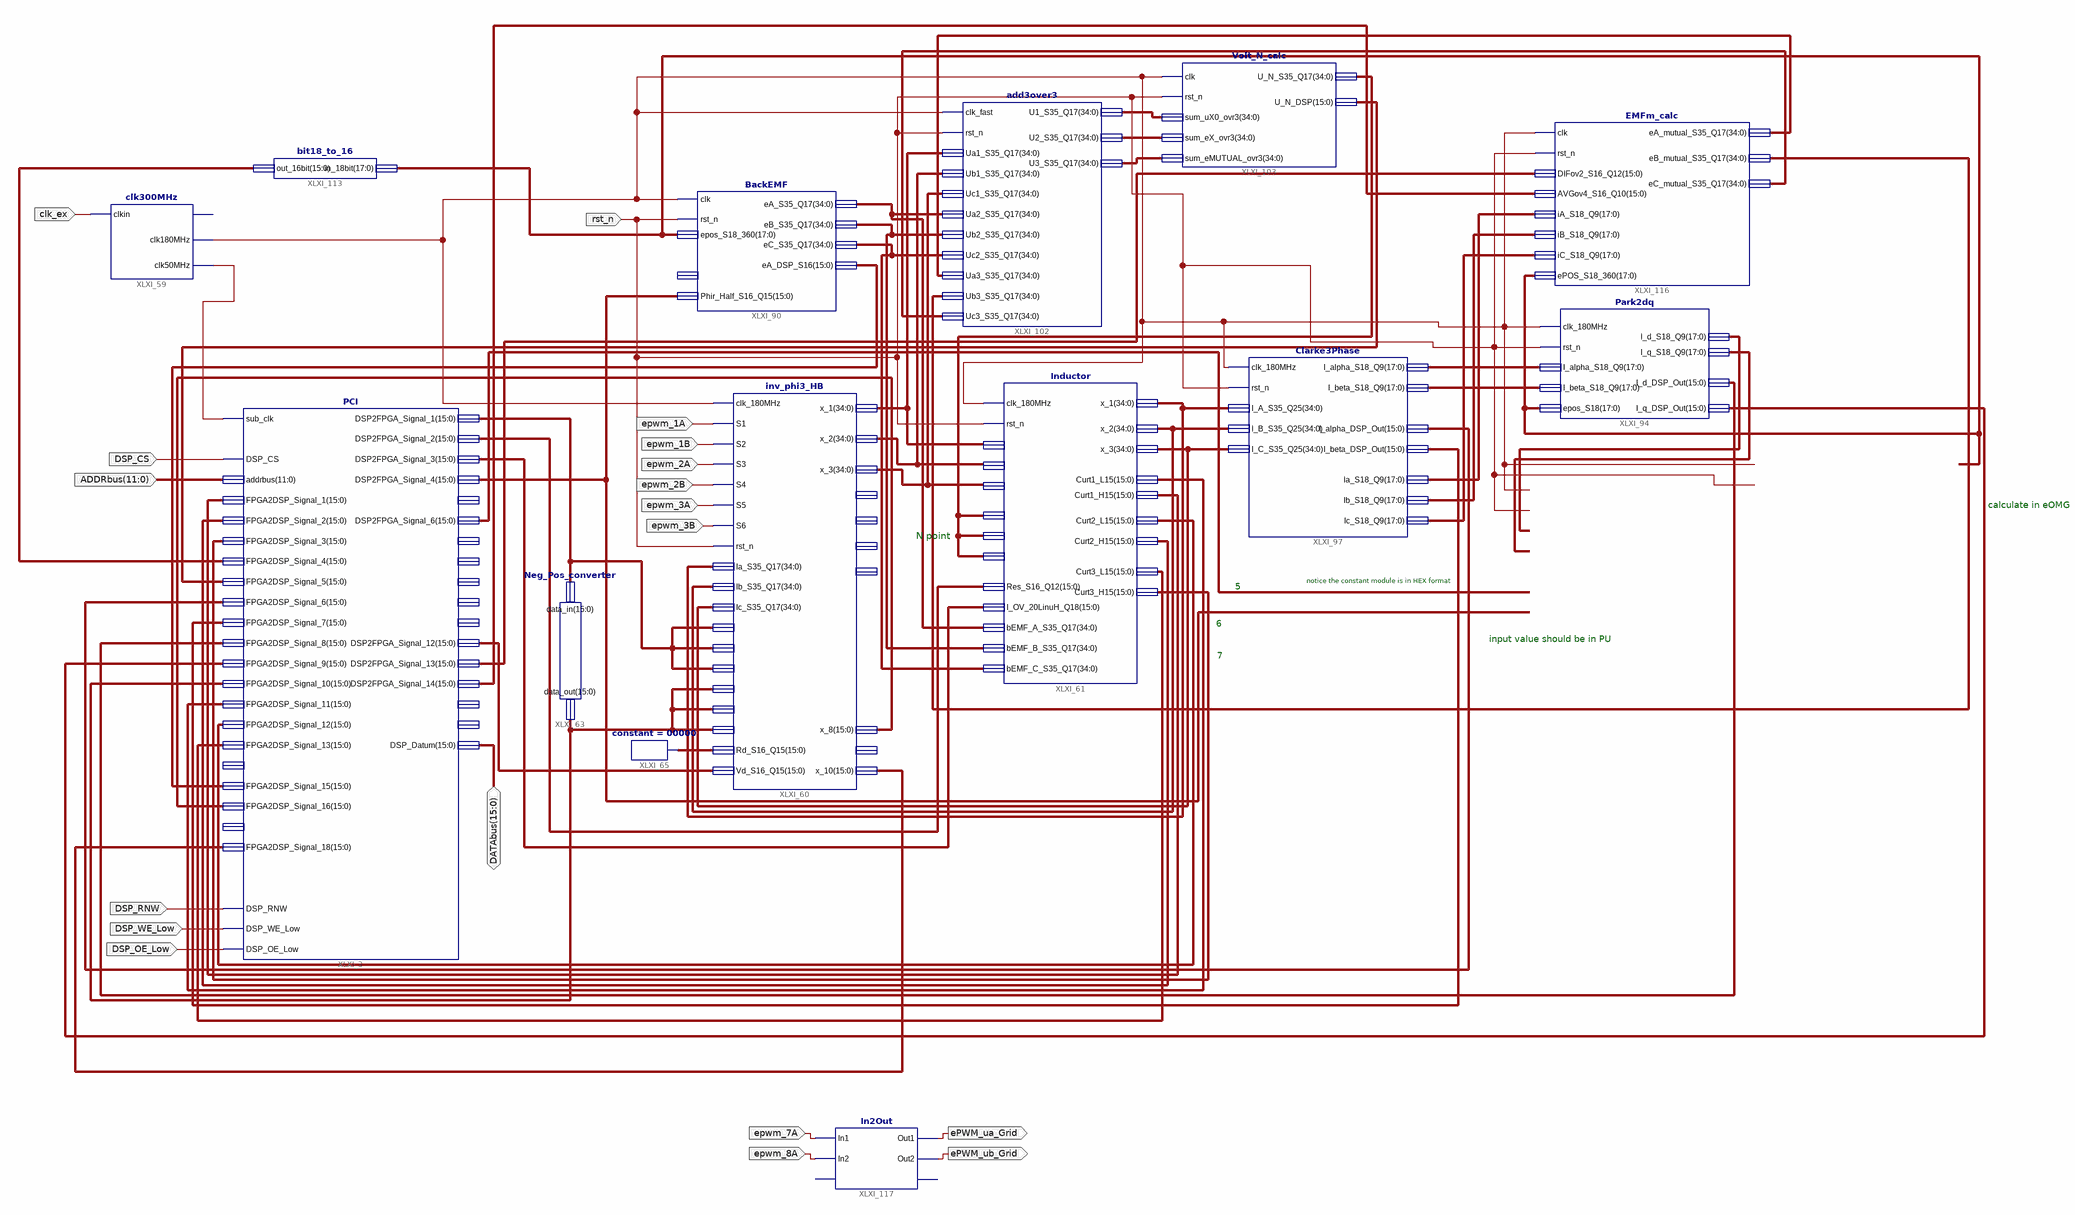
[diagram p0: schematic sheet 1]
// Xilinx ISE schematic main.sch (spartan6) as structural Verilog: 14 symbols, 18 ports
module main (
  input  DSP_CS,
  input  clk_ex,
  input  DSP_RNW,
  input  DSP_WE_Low,
  input  DSP_OE_Low,
  input  [11:0] ADDRbus,
  input  epwm_1A,
  input  epwm_1B,
  input  epwm_2A,
  input  epwm_2B,
  input  epwm_3A,
  input  epwm_3B,
  input  rst_n,
  input  epwm_7A,
  input  epwm_8A,
  inout  [15:0] DATAbus,
  output ePWM_ua_Grid,
  output ePWM_ub_Grid
);

  wire XLXN_1300, XLXN_1656;
  wire [15:0] XLXN_1005, XLXN_1007, XLXN_1524, XLXN_1560, XLXN_1566, XLXN_1568, XLXN_1573, XLXN_1607,
       XLXN_1608, XLXN_1609, XLXN_1613, XLXN_1614, XLXN_1615, XLXN_1616, XLXN_1661, XLXN_1662, XLXN_1663,
       XLXN_1664, XLXN_1665, XLXN_1667, XLXN_1668, XLXN_1672, XLXN_1673, XLXN_1674, XLXN_1695;
  wire [17:0] XLXN_1528, XLXN_1554, XLXN_1610, XLXN_1649, XLXN_1650, XLXN_1652, XLXN_1653, XLXN_1654;
  wire [34:0] XLXN_1218, XLXN_1219, XLXN_1415, XLXN_1460, XLXN_1461, XLXN_1464, XLXN_1465, XLXN_1466,
       XLXN_1498, XLXN_1499, XLXN_1501, XLXN_1548, XLXN_1557, XLXN_1669, XLXN_1670, XLXN_1671;

  PCI XLXI_3 (
    .sub_clk(XLXN_1300), .DSP_RNW(DSP_RNW), .DSP_WE_Low(DSP_WE_Low), .DSP_OE_Low(DSP_OE_Low),
    .DSP_CS(DSP_CS), .addrbus(ADDRbus), .FPGA2DSP_Signal_1(XLXN_1607), .FPGA2DSP_Signal_2(XLXN_1608),
    .FPGA2DSP_Signal_3(XLXN_1609), .FPGA2DSP_Signal_4(XLXN_1573), .FPGA2DSP_Signal_5(XLXN_1615),
    .FPGA2DSP_Signal_6(XLXN_1613), .FPGA2DSP_Signal_7(XLXN_1614), .FPGA2DSP_Signal_8(XLXN_1667),
    .FPGA2DSP_Signal_9(XLXN_1668), .FPGA2DSP_Signal_10(XLXN_1662), .FPGA2DSP_Signal_11(XLXN_1663),
    .FPGA2DSP_Signal_12(XLXN_1664), .FPGA2DSP_Signal_13(XLXN_1665), .FPGA2DSP_Signal_15(XLXN_1674),
    .FPGA2DSP_Signal_16(XLXN_1616), .FPGA2DSP_Signal_18(XLXN_1695), .DSP_Datum(DATAbus),
    .DSP2FPGA_Signal_1(XLXN_1661), .DSP2FPGA_Signal_2(XLXN_1005), .DSP2FPGA_Signal_3(XLXN_1007),
    .DSP2FPGA_Signal_4(XLXN_1524), .DSP2FPGA_Signal_6(XLXN_1560), .DSP2FPGA_Signal_12(XLXN_1568),
    .DSP2FPGA_Signal_13(XLXN_1672), .DSP2FPGA_Signal_14(XLXN_1673));  // open: FPGA2DSP_Signal_14, FPGA2DSP_Signal_17, DSP2FPGA_Signal_5, DSP2FPGA_Signal_7, DSP2FPGA_Signal_8, DSP2FPGA_Signal_9, DSP2FPGA_Signal_10, DSP2FPGA_Signal_11, DSP2FPGA_Signal_15, DSP2FPGA_Signal_16
  inv_phi3_HB XLXI_60 (
    .clk_180MHz(XLXN_1656), .S1(epwm_1A), .S2(epwm_1B), .S3(epwm_2A), .S4(epwm_2B), .S5(epwm_3A),
    .S6(epwm_3B), .rst_n(rst_n), .Ia_S35_Q17(XLXN_1218), .Ib_S35_Q17(XLXN_1219), .Ic_S35_Q17(XLXN_1415),
    .Udc1P_S16_Q5(XLXN_1661), .Udc2P_S16_Q5(XLXN_1661), .Udc3P_S16_Q5(XLXN_1661), .Udc1N_S16_Q5(XLXN_1662),
    .Udc2N_S16_Q5(XLXN_1662), .Udc3N_S16_Q5(XLXN_1662), .Rd_S16_Q15(XLXN_1566), .Vd_S16_Q15(XLXN_1568),
    .x_1(XLXN_1548), .x_2(XLXN_1460), .x_3(XLXN_1461), .x_8(XLXN_1616), .x_10(XLXN_1695));  // open: x_4, x_5, x_6, x_7, x_9
  constant #(.CValue("00000")) XLXI_65 (.O(XLXN_1566));
  Inductor XLXI_61 (
    .clk_180MHz(XLXN_1656), .rst_n(rst_n), .UAO_P_S35(XLXN_1548), .UBO_P_S35(XLXN_1460),
    .UCO_P_S35(XLXN_1461), .UAO_N_S35(XLXN_1557), .UBO_N_S35(XLXN_1557), .UCO_N_S35(XLXN_1557),
    .I_OV_20LinuH_Q18(XLXN_1007), .Res_S16_Q12(XLXN_1005), .x_1(XLXN_1218), .x_2(XLXN_1219), .x_3(XLXN_1415),
    .Curt1_L15(XLXN_1663), .Curt1_H15(XLXN_1607), .Curt2_L15(XLXN_1664), .Curt2_H15(XLXN_1608),
    .Curt3_L15(XLXN_1665), .Curt3_H15(XLXN_1609), .bEMF_A_S35_Q17(XLXN_1464), .bEMF_B_S35_Q17(XLXN_1465),
    .bEMF_C_S35_Q17(XLXN_1466));
  add3over3 XLXI_102 (
    .clk_fast(XLXN_1656), .rst_n(rst_n), .Ua1_S35_Q17(XLXN_1548), .Ub1_S35_Q17(XLXN_1460),
    .Uc1_S35_Q17(XLXN_1461), .Ua2_S35_Q17(XLXN_1464), .Ub2_S35_Q17(XLXN_1465), .Uc2_S35_Q17(XLXN_1466),
    .Ua3_S35_Q17(XLXN_1669), .Ub3_S35_Q17(XLXN_1670), .Uc3_S35_Q17(XLXN_1671), .U1_S35_Q17(XLXN_1498),
    .U2_S35_Q17(XLXN_1499), .U3_S35_Q17(XLXN_1501));
  Volt_N_calc XLXI_103 (
    .clk(XLXN_1656), .rst_n(rst_n), .sum_uX0_ovr3(XLXN_1498), .sum_eX_ovr3(XLXN_1499),
    .sum_eMUTUAL_ovr3(XLXN_1501), .U_N_S35_Q17(XLXN_1557), .U_N_DSP(XLXN_1615));
  Neg_Pos_converter XLXI_63 (.data_in(XLXN_1661), .data_out(XLXN_1662));
  BackEMF XLXI_90 (
    .clk(XLXN_1656), .rst_n(rst_n), .epos_S18_360(XLXN_1554), .Phir_Half_S16_Q15(XLXN_1524),
    .eA_S35_Q17(XLXN_1464), .eB_S35_Q17(XLXN_1465), .eC_S35_Q17(XLXN_1466), .eA_DSP_S16(XLXN_1674));  // open: eOMG_S18_Q4
  Clarke3Phase XLXI_97 (
    .clk_180MHz(XLXN_1656), .rst_n(rst_n), .I_A_S35_Q25(XLXN_1218), .I_B_S35_Q25(XLXN_1219),
    .I_C_S35_Q25(XLXN_1415), .I_alpha_DSP_Out(XLXN_1613), .I_beta_DSP_Out(XLXN_1614),
    .I_alpha_S18_Q9(XLXN_1610), .I_beta_S18_Q9(XLXN_1528), .Ia_S18_Q9(XLXN_1652), .Ib_S18_Q9(XLXN_1653),
    .Ic_S18_Q9(XLXN_1654));
  Park2dq XLXI_94 (
    .clk_180MHz(XLXN_1656), .rst_n(rst_n), .epos_S18(XLXN_1554), .I_beta_S18_Q9(XLXN_1528),
    .I_d_S18_Q9(XLXN_1649), .I_q_S18_Q9(XLXN_1650), .I_alpha_S18_Q9(XLXN_1610), .I_d_DSP_Out(XLXN_1667),
    .I_q_DSP_Out(XLXN_1668));
  clk300MHz XLXI_59 (.clkin(clk_ex), .clk50MHz(XLXN_1300), .clk180MHz(XLXN_1656));  // open: clk300MHz
  bit18_to_16 XLXI_113 (.in_18bit(XLXN_1554), .out_16bit(XLXN_1573));
  EMFm_calc XLXI_116 (
    .clk(XLXN_1656), .rst_n(rst_n), .DIFov2_S16_Q12(XLXN_1672), .AVGov4_S16_Q10(XLXN_1673),
    .iA_S18_Q9(XLXN_1652), .iB_S18_Q9(XLXN_1653), .iC_S18_Q9(XLXN_1654), .ePOS_S18_360(XLXN_1554),
    .eA_mutual_S35_Q17(XLXN_1669), .eB_mutual_S35_Q17(XLXN_1670), .eC_mutual_S35_Q17(XLXN_1671));
  In2Out XLXI_117 (.In1(epwm_7A), .In2(epwm_8A), .Out1(ePWM_ua_Grid), .Out2(ePWM_ub_Grid));  // open: In3, Out3

  // Notes on the sheet:
  //   calculate in eOMG
  //   N point
  //   notice the constant module is in HEX format
  //   5
  //   6
  //   input value should be in PU
  //   7
endmodule
